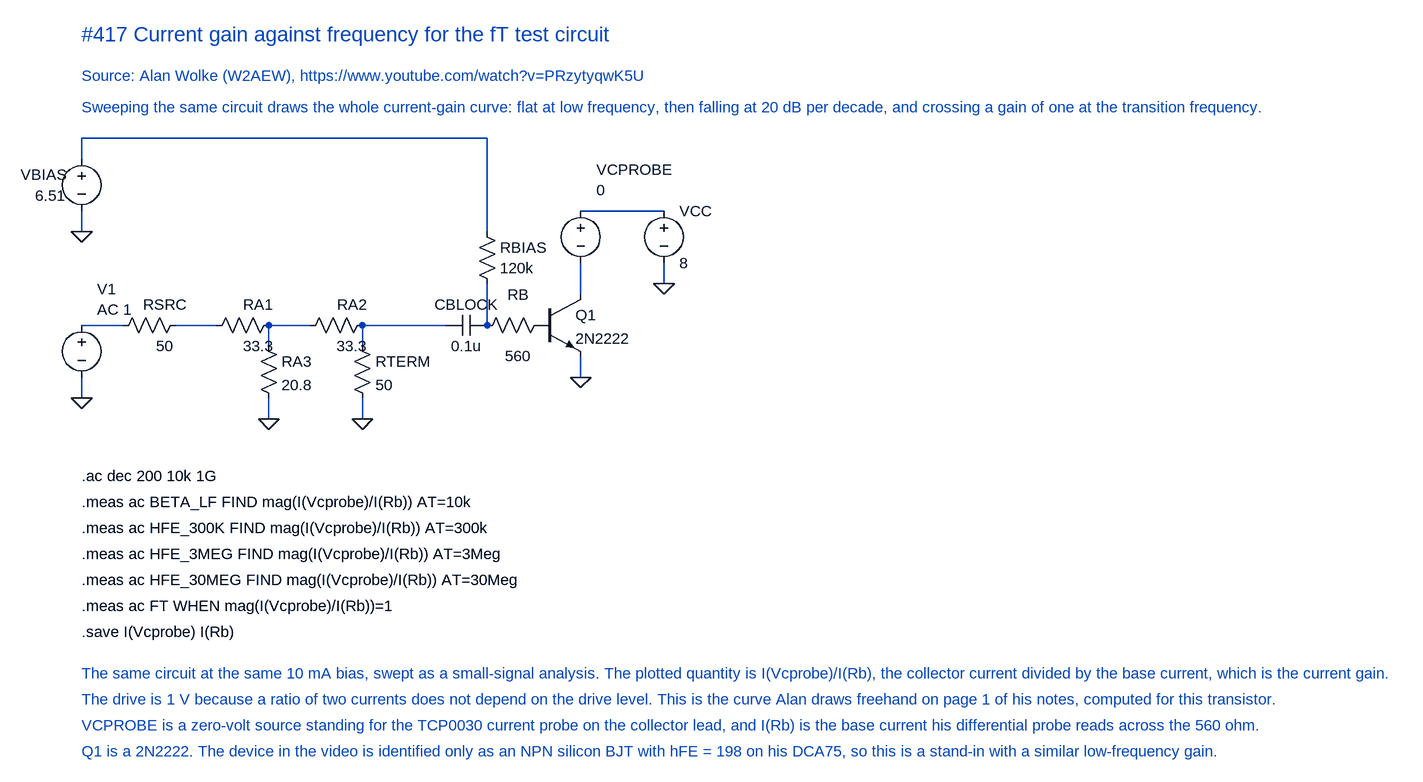
[diagram p0: schematic Current gain frequency sweep.asc]
Current gain frequency sweep.asc, the LTspice schematic file:
Version 4
SHEET 1 2400 1400
WIRE 96 80 96 112
WIRE 96 80 720 80
WIRE 96 192 96 224
WIRE 96 368 160 368
WIRE 96 448 96 480
WIRE 240 368 304 368
WIRE 384 368 448 368
WIRE 384 368 384 400
WIRE 384 480 384 512
WIRE 528 368 528 400
WIRE 528 368 656 368
WIRE 528 480 528 512
WIRE 720 80 720 224
WIRE 720 368 720 304
WIRE 864 320 864 272
WIRE 864 192 992 192
WIRE 864 416 864 448
WIRE 992 272 992 304
FLAG 96 224 0
FLAG 96 480 0
FLAG 384 512 0
FLAG 528 512 0
FLAG 864 448 0
FLAG 992 304 0
SYMBOL voltage 96 352 R0
WINDOW 0 24 -40 Left 2
WINDOW 3 24 -8 Left 2
SYMATTR InstName V1
SYMATTR Value AC 1
SYMBOL voltage 96 96 R0
WINDOW 0 -24 40 Right 2
WINDOW 3 -24 72 Right 2
SYMATTR InstName VBIAS
SYMATTR Value 6.51
SYMBOL res 256 352 R90
WINDOW 0 0 32 VBottom 2
WINDOW 3 32 32 VTop 2
SYMATTR InstName RSRC
SYMATTR Value 50
SYMBOL res 400 352 R90
WINDOW 0 0 32 VBottom 2
WINDOW 3 32 32 VTop 2
SYMATTR InstName RA1
SYMATTR Value 33.3
SYMBOL res 368 384 R0
SYMATTR InstName RA3
SYMATTR Value 20.8
SYMBOL res 544 352 R90
WINDOW 0 0 32 VBottom 2
WINDOW 3 32 32 VTop 2
SYMATTR InstName RA2
SYMATTR Value 33.3
SYMBOL res 512 384 R0
SYMATTR InstName RTERM
SYMATTR Value 50
SYMBOL cap 720 352 R90
WINDOW 0 0 32 VBottom 2
WINDOW 3 32 32 VTop 2
SYMATTR InstName CBLOCK
SYMATTR Value 0.1u
SYMBOL res 704 208 R0
WINDOW 0 36 40 Left 2
WINDOW 3 36 72 Left 2
SYMATTR InstName RBIAS
SYMATTR Value 120k
SYMBOL res 704 384 R270
WINDOW 0 48 64 VTop 2
WINDOW 3 -16 64 VBottom 2
SYMATTR InstName RB
SYMATTR Value 560
SYMBOL npn 800 320 R0
SYMATTR InstName Q1
SYMATTR Value 2N2222
SYMBOL voltage 864 176 R0
WINDOW 0 24 -48 Left 2
WINDOW 3 24 -16 Left 2
SYMATTR InstName VCPROBE
SYMATTR Value 0
SYMBOL voltage 992 176 R0
SYMATTR InstName VCC
SYMATTR Value 8
TEXT 96 -80 Left 3 ;#417 Current gain against frequency for the fT test circuit
TEXT 96 -16 Left 2 ;Source: Alan Wolke (W2AEW), https://www.youtube.com/watch?v=PRzytyqwK5U
TEXT 96 32 Left 2 ;Sweeping the same circuit draws the whole current-gain curve: flat at low frequency, then falling at 20 dB per decade, and crossing a gain of one at the transition frequency.
TEXT 96 600 Left 2 !.ac dec 200 10k 1G
TEXT 96 640 Left 2 !.meas ac BETA_LF FIND mag(I(Vcprobe)/I(Rb)) AT=10k
TEXT 96 680 Left 2 !.meas ac HFE_300K FIND mag(I(Vcprobe)/I(Rb)) AT=300k
TEXT 96 720 Left 2 !.meas ac HFE_3MEG FIND mag(I(Vcprobe)/I(Rb)) AT=3Meg
TEXT 96 760 Left 2 !.meas ac HFE_30MEG FIND mag(I(Vcprobe)/I(Rb)) AT=30Meg
TEXT 96 800 Left 2 !.meas ac FT WHEN mag(I(Vcprobe)/I(Rb))=1
TEXT 96 840 Left 2 !.save I(Vcprobe) I(Rb)
TEXT 96 904 Left 2 ;The same circuit at the same 10 mA bias, swept as a small-signal analysis. The plotted quantity is I(Vcprobe)/I(Rb), the collector current divided by the base current, which is the current gain.
TEXT 96 944 Left 2 ;The drive is 1 V because a ratio of two currents does not depend on the drive level. This is the curve Alan draws freehand on page 1 of his notes, computed for this transistor.
TEXT 96 984 Left 2 ;VCPROBE is a zero-volt source standing for the TCP0030 current probe on the collector lead, and I(Rb) is the base current his differential probe reads across the 560 ohm.
TEXT 96 1024 Left 2 ;Q1 is a 2N2222. The device in the video is identified only as an NPN silicon BJT with hFE = 198 on his DCA75, so this is a stand-in with a similar low-frequency gain.

The netlist it stands for:
* Current gain frequency sweep.asc
V1 N002 0 AC 1
VBIAS N001 0 6.51
RSRC N003 N002 50
RA1 N004 N003 33.3
RA3 N004 0 20.8
RA2 N005 N004 33.3
RTERM N005 0 50
CBLOCK N006 N005 0.1u
RBIAS N001 N006 120k
RB N006 P001 560
Q1 N007 P001 0 0 2N2222
VCPROBE N008 N007 0
VCC N008 0 8
.model NPN NPN
.model PNP PNP
.lib standard.bjt
* #417 Current gain against frequency for the fT test circuit
* Source: Alan Wolke (W2AEW), https://www.youtube.com/watch?v=PRzytyqwK5U
* Sweeping the same circuit draws the whole current-gain curve: flat at low frequency, then falling at 20 dB per decade, and crossing a gain of one at the transition frequency.
.ac dec 200 10k 1G
.meas ac BETA_LF FIND mag(I(Vcprobe)/I(Rb)) AT=10k
.meas ac HFE_300K FIND mag(I(Vcprobe)/I(Rb)) AT=300k
.meas ac HFE_3MEG FIND mag(I(Vcprobe)/I(Rb)) AT=3Meg
.meas ac HFE_30MEG FIND mag(I(Vcprobe)/I(Rb)) AT=30Meg
.meas ac FT WHEN mag(I(Vcprobe)/I(Rb))=1
.save I(Vcprobe) I(Rb)
* The same circuit at the same 10 mA bias, swept as a small-signal analysis. The plotted quantity is I(Vcprobe)/I(Rb), the collector current divided by the base current, which is the current gain.
* The drive is 1 V because a ratio of two currents does not depend on the drive level. This is the curve Alan draws freehand on page 1 of his notes, computed for this transistor.
* VCPROBE is a zero-volt source standing for the TCP0030 current probe on the collector lead, and I(Rb) is the base current his differential probe reads across the 560 ohm.
* Q1 is a 2N2222. The device in the video is identified only as an NPN silicon BJT with hFE = 198 on his DCA75, so this is a stand-in with a similar low-frequency gain.
.backanno
.end